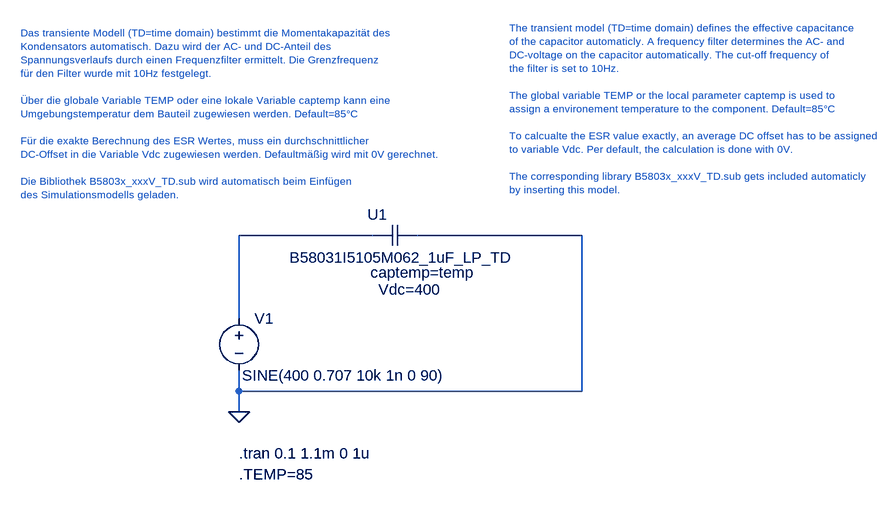
[diagram p0: schematic Testbench_B5803x_TD.asc]
Testbench_B5803x_TD.asc, the LTspice schematic file:
Version 4.1
SHEET 1 1228 680
WIRE 240 80 32 80
WIRE 560 80 304 80
WIRE 32 208 32 80
WIRE 32 320 32 288
WIRE 560 320 560 80
WIRE 560 320 32 320
WIRE 32 352 32 320
FLAG 32 352 0
SYMBOL voltage 32 192 R0
WINDOW 3 5 104 Left 2
WINDOW 123 24 44 Left 2
WINDOW 39 0 0 Left 2
SYMATTR Value SINE(400 0.707 10k 1n 0 90)
SYMATTR InstName V1
SYMBOL TDK\\B5803x_500V_TD 272 80 R0
SYMATTR InstName U1
TEXT 32 416 Left 2 !.tran 0.1 1.1m 0 1u
TEXT 32 448 Left 2 !.TEMP=85
TEXT -304 -232 Left 1 ;Das transiente Modell (TD=time domain) bestimmt die Momentakapazität des\nKondensators automatisch. Dazu wird der AC- und DC-Anteil des\nSpannungsverlaufs durch einen Frequenzfilter ermittelt. Die Grenzfrequenz \nfür den Filter wurde mit 10Hz festgelegt.\n \nÜber die globale Variable TEMP oder eine lokale Variable captemp kann eine\nUmgebungstemperatur dem Bauteil zugewiesen werden. Default=85°C\n \nFür die exakte Berechnung des ESR Wertes, muss ein durchschnittlicher \nDC-Offset in die Variable Vdc zugewiesen werden. Defaultmäßig wird mit 0V gerechnet.\n \nDie Bibliothek B5803x_xxxV_TD.sub wird automatisch beim Einfügen \ndes Simulationsmodells geladen.
TEXT 448 -240 Left 1 ;The transient model (TD=time domain) defines the effective capacitance \nof the capacitor automaticly. A frequency filter determines the AC- and \nDC-voltage on the capacitor automatically. The cut-off frequency of \nthe filter is set to 10Hz.\n \nThe global variable TEMP or the local parameter captemp is used to \nassign a environement temperature to the component. Default=85°C\n \nTo calcualte the ESR value exactly, an average DC offset has to be assigned\nto variable Vdc. Per default, the calculation is done with 0V.\n \nThe corresponding library B5803x_xxxV_TD.sub gets included automaticly \nby inserting this model.

The netlist it stands for:
* Testbench_B5803x_TD.asc
V1 N001 0 SINE(400 0.707 10k 1n 0 90)
X§U1 N001 0 B58031I5105M062_1uF_LP_TD captemp=temp Vdc=400  ; pins A1 A2
.tran 0.1 1.1m 0 1u
.TEMP=85
* Das transiente Modell (TD=time domain) bestimmt die Momentakapazität des
* Kondensators automatisch. Dazu wird der AC- und DC-Anteil des
* Spannungsverlaufs durch einen Frequenzfilter ermittelt. Die Grenzfrequenz
* für den Filter wurde mit 10Hz festgelegt.
* Über die globale Variable TEMP oder eine lokale Variable captemp kann eine
* Umgebungstemperatur dem Bauteil zugewiesen werden. Default=85°C
* Für die exakte Berechnung des ESR Wertes, muss ein durchschnittlicher
* DC-Offset in die Variable Vdc zugewiesen werden. Defaultmäßig wird mit 0V gerechnet.
* Die Bibliothek B5803x_xxxV_TD.sub wird automatisch beim Einfügen
* des Simulationsmodells geladen.
* The transient model (TD=time domain) defines the effective capacitance
* of the capacitor automaticly. A frequency filter determines the AC- and
* DC-voltage on the capacitor automatically. The cut-off frequency of
* the filter is set to 10Hz.
* The global variable TEMP or the local parameter captemp is used to
* assign a environement temperature to the component. Default=85°C
* To calcualte the ESR value exactly, an average DC offset has to be assigned
* to variable Vdc. Per default, the calculation is done with 0V.
* The corresponding library B5803x_xxxV_TD.sub gets included automaticly
* by inserting this model.
.lib B5803x_500V_TD.sub
.backanno
.end